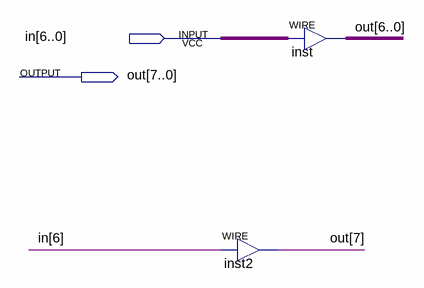
[diagram p0: schematic sheet]
// Quartus schematic signExtend7x8.bdf as structural Verilog: 2 symbols, 2 pins
module signExtend7x8 (
  input  [6:0] in,
  output [7:0] out
);

  assign out[7] = in[6];  // WIRE inst2
  assign out[6:0] = in;  // WIRE inst
endmodule
